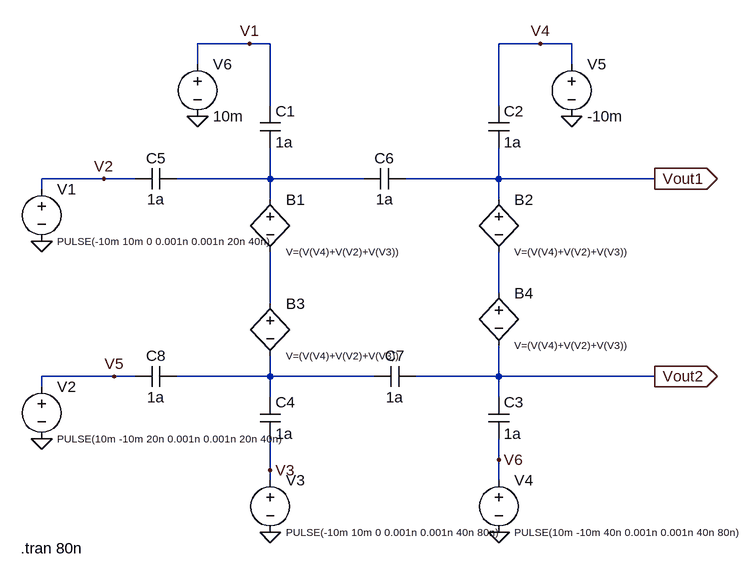
[diagram p0: schematic ANDgate_in_ltpice.asc]
ANDgate_in_ltpice.asc, the LTspice schematic file:
Version 4.1
SHEET 1 880 680
WIRE -400 -368 -480 -368
WIRE -368 -368 -400 -368
WIRE 48 -368 -16 -368
WIRE 96 -368 48 -368
WIRE -480 -336 -480 -368
WIRE 96 -336 96 -368
WIRE -368 -272 -368 -368
WIRE -16 -272 -16 -368
WIRE -624 -160 -720 -160
WIRE -576 -160 -624 -160
WIRE -368 -160 -368 -208
WIRE -368 -160 -512 -160
WIRE -224 -160 -368 -160
WIRE -16 -160 -16 -208
WIRE -16 -160 -160 -160
WIRE 224 -160 -16 -160
WIRE -720 -144 -720 -160
WIRE -368 -128 -368 -160
WIRE -16 -128 -16 -160
WIRE -16 16 -16 -48
WIRE -368 32 -368 -48
WIRE -608 144 -720 144
WIRE -576 144 -608 144
WIRE -368 144 -368 112
WIRE -368 144 -512 144
WIRE -208 144 -368 144
WIRE -16 144 -16 96
WIRE -16 144 -144 144
WIRE 224 144 -16 144
WIRE -720 160 -720 144
WIRE -368 176 -368 144
WIRE -16 176 -16 144
WIRE -16 272 -16 240
WIRE -368 288 -368 240
WIRE -368 304 -368 288
WIRE -16 304 -16 272
FLAG -480 -256 0
FLAG -720 -64 0
FLAG -720 240 0
FLAG -368 384 0
FLAG -16 384 0
FLAG 96 -256 0
FLAG -400 -368 V1
FLAG -624 -160 V2
FLAG -608 144 V5
FLAG -368 288 V3
FLAG -16 272 V6
FLAG 48 -368 V4
FLAG 224 -160 Vout1
IOPIN 224 -160 Out
FLAG 224 144 Vout2
IOPIN 224 144 Out
SYMBOL bv -368 -144 R0
WINDOW 3 24 96 Left 1
SYMATTR InstName B1
SYMATTR Value V=(V(V4)+V(V2)+V(V3))
SYMBOL bv -16 -144 R0
WINDOW 3 24 96 Left 1
SYMATTR InstName B2
SYMATTR Value V=(V(V4)+V(V2)+V(V3))
SYMBOL bv -368 16 R0
WINDOW 3 24 96 Left 1
SYMATTR InstName B3
SYMATTR Value V=(V(V4)+V(V2)+V(V3))
SYMBOL bv -16 0 R0
WINDOW 3 24 96 Left 1
SYMATTR InstName B4
SYMATTR Value V=(V(V4)+V(V2)+V(V3))
SYMBOL cap -384 -272 R0
SYMATTR InstName C1
SYMATTR Value 1a
SYMBOL cap -32 -272 R0
SYMATTR InstName C2
SYMATTR Value 1a
SYMBOL cap -32 176 R0
SYMATTR InstName C3
SYMATTR Value 1a
SYMBOL cap -384 176 R0
SYMATTR InstName C4
SYMATTR Value 1a
SYMBOL cap -512 -176 R90
WINDOW 0 0 32 VBottom 2
WINDOW 3 32 32 VTop 2
SYMATTR InstName C5
SYMATTR Value 1a
SYMBOL cap -160 -176 R90
WINDOW 0 0 32 VBottom 2
WINDOW 3 32 32 VTop 2
SYMATTR InstName C6
SYMATTR Value 1a
SYMBOL cap -144 128 R90
WINDOW 0 0 32 VBottom 2
WINDOW 3 32 32 VTop 2
SYMATTR InstName C7
SYMATTR Value 1a
SYMBOL cap -512 128 R90
WINDOW 0 0 32 VBottom 2
WINDOW 3 32 32 VTop 2
SYMATTR InstName C8
SYMATTR Value 1a
SYMBOL voltage -720 -160 R0
WINDOW 3 24 96 Left 1
WINDOW 123 0 0 Left 0
WINDOW 39 0 0 Left 0
SYMATTR Value PULSE(-10m 10m 0 0.001n 0.001n 20n 40n)
SYMATTR InstName V1
SYMBOL voltage -720 144 R0
WINDOW 3 24 96 Left 1
WINDOW 123 0 0 Left 0
WINDOW 39 0 0 Left 0
SYMATTR Value PULSE(10m -10m 20n 0.001n 0.001n 20n 40n)
SYMATTR InstName V2
SYMBOL voltage -368 288 R0
WINDOW 3 24 96 Left 1
WINDOW 123 0 0 Left 0
WINDOW 39 0 0 Left 0
SYMATTR Value PULSE(-10m 10m 0 0.001n 0.001n 40n 80n)
SYMATTR InstName V3
SYMBOL voltage -16 288 R0
WINDOW 3 24 96 Left 1
WINDOW 123 0 0 Left 0
WINDOW 39 0 0 Left 0
SYMATTR Value PULSE(10m -10m 40n 0.001n 0.001n 40n 80n)
SYMATTR InstName V4
SYMBOL voltage -480 -352 R0
WINDOW 123 0 0 Left 0
WINDOW 39 0 0 Left 0
SYMATTR InstName V6
SYMATTR Value 10m
SYMBOL voltage 96 -352 R0
WINDOW 123 0 0 Left 0
WINDOW 39 0 0 Left 0
SYMATTR InstName V5
SYMATTR Value -10m
TEXT -752 408 Left 2 !.tran 80n

The netlist it stands for:
* ANDgate_in_ltpice.asc
B1 N001 N003 V=(V(V4)+V(V2)+V(V3))
B2 Vout1 N002 V=(V(V4)+V(V2)+V(V3))
B3 N003 N004 V=(V(V4)+V(V2)+V(V3))
B4 N002 Vout2 V=(V(V4)+V(V2)+V(V3))
C1 V1 N001 1a
C2 V4 Vout1 1a
C3 Vout2 V6 1a
C4 N004 V3 1a
C5 N001 V2 1a
C6 Vout1 N001 1a
C7 Vout2 N004 1a
C8 N004 V5 1a
V1 V2 0 PULSE(-10m 10m 0 0.001n 0.001n 20n 40n)
V2 V5 0 PULSE(10m -10m 20n 0.001n 0.001n 20n 40n)
V3 V3 0 PULSE(-10m 10m 0 0.001n 0.001n 40n 80n)
V4 V6 0 PULSE(10m -10m 40n 0.001n 0.001n 40n 80n)
V6 V1 0 10m
V5 V4 0 -10m
.tran 80n
.backanno
.end